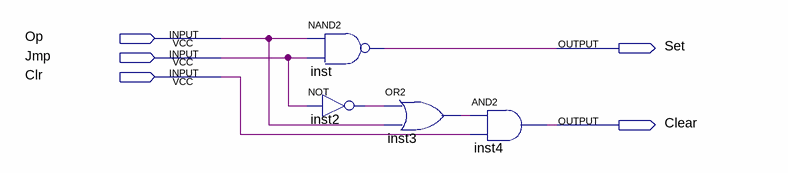
[diagram p0: schematic sheet]
// Quartus schematic jmpr.bdf as structural Verilog: 4 symbols, 5 pins
module jmpr (
  input  Op,
  input  Jmp,
  input  Clr,
  output Set,
  output Clear
);

  wire inst2_out, inst3_out;

  nand inst (Set, Op, Jmp);
  not inst2 (inst2_out, Jmp);
  or inst3 (inst3_out, inst2_out, Op);
  and inst4 (Clear, inst3_out, Clr);
endmodule
